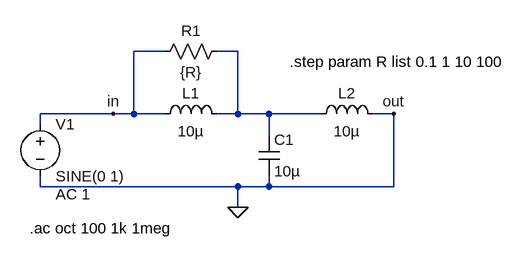
[diagram p0: schematic lc_filter_damping.asc]
lc_filter_damping.asc, the LTspice schematic file:
Version 4
SHEET 1 880 680
WIRE 144 48 96 48
WIRE 256 48 224 48
WIRE 64 144 -48 144
WIRE 96 144 96 48
WIRE 96 144 64 144
WIRE 144 144 96 144
WIRE 256 144 256 48
WIRE 256 144 224 144
WIRE 304 144 256 144
WIRE 384 144 304 144
WIRE 496 144 464 144
WIRE -48 160 -48 144
WIRE 304 176 304 144
WIRE -48 256 -48 240
WIRE 256 256 -48 256
WIRE 304 256 304 240
WIRE 304 256 256 256
WIRE 496 256 496 144
WIRE 496 256 304 256
WIRE 256 288 256 256
FLAG 256 288 0
FLAG 496 144 out
FLAG 64 144 in
SYMBOL ind 128 160 R270
WINDOW 0 32 56 VTop 2
WINDOW 3 5 56 VBottom 2
SYMATTR InstName L1
SYMATTR Value 10µ
SYMBOL cap 288 176 R0
SYMATTR InstName C1
SYMATTR Value 10µ
SYMBOL voltage -48 144 R0
WINDOW 123 24 124 Left 2
WINDOW 39 0 0 Left 0
SYMATTR Value2 AC 1
SYMATTR InstName V1
SYMATTR Value SINE(0 1)
SYMBOL res 240 32 R90
WINDOW 0 0 56 VBottom 2
WINDOW 3 32 56 VTop 2
SYMATTR InstName R1
SYMATTR Value {R}
SYMBOL ind 368 160 R270
WINDOW 0 32 56 VTop 2
WINDOW 3 5 56 VBottom 2
SYMATTR InstName L2
SYMATTR Value 10µ
TEXT -64 320 Left 2 !.ac oct 100 1k 1meg
TEXT 336 64 Left 2 !.step param R list 0.1 1 10 100

The netlist it stands for:
* lc_filter_damping.asc
L1 in N001 10µ
C1 N001 0 10µ
V1 in 0 SINE(0 1) AC 1
R1 N001 in {R}
L2 N001 0 10µ
.ac oct 100 1k 1meg
.step param R list 0.1 1 10 100
.backanno
.end